# Altium schematic sheet Connector_Section.SchDoc
size A4; DocumentNumber: 7; SheetNumber: 7; SheetTotal: 7
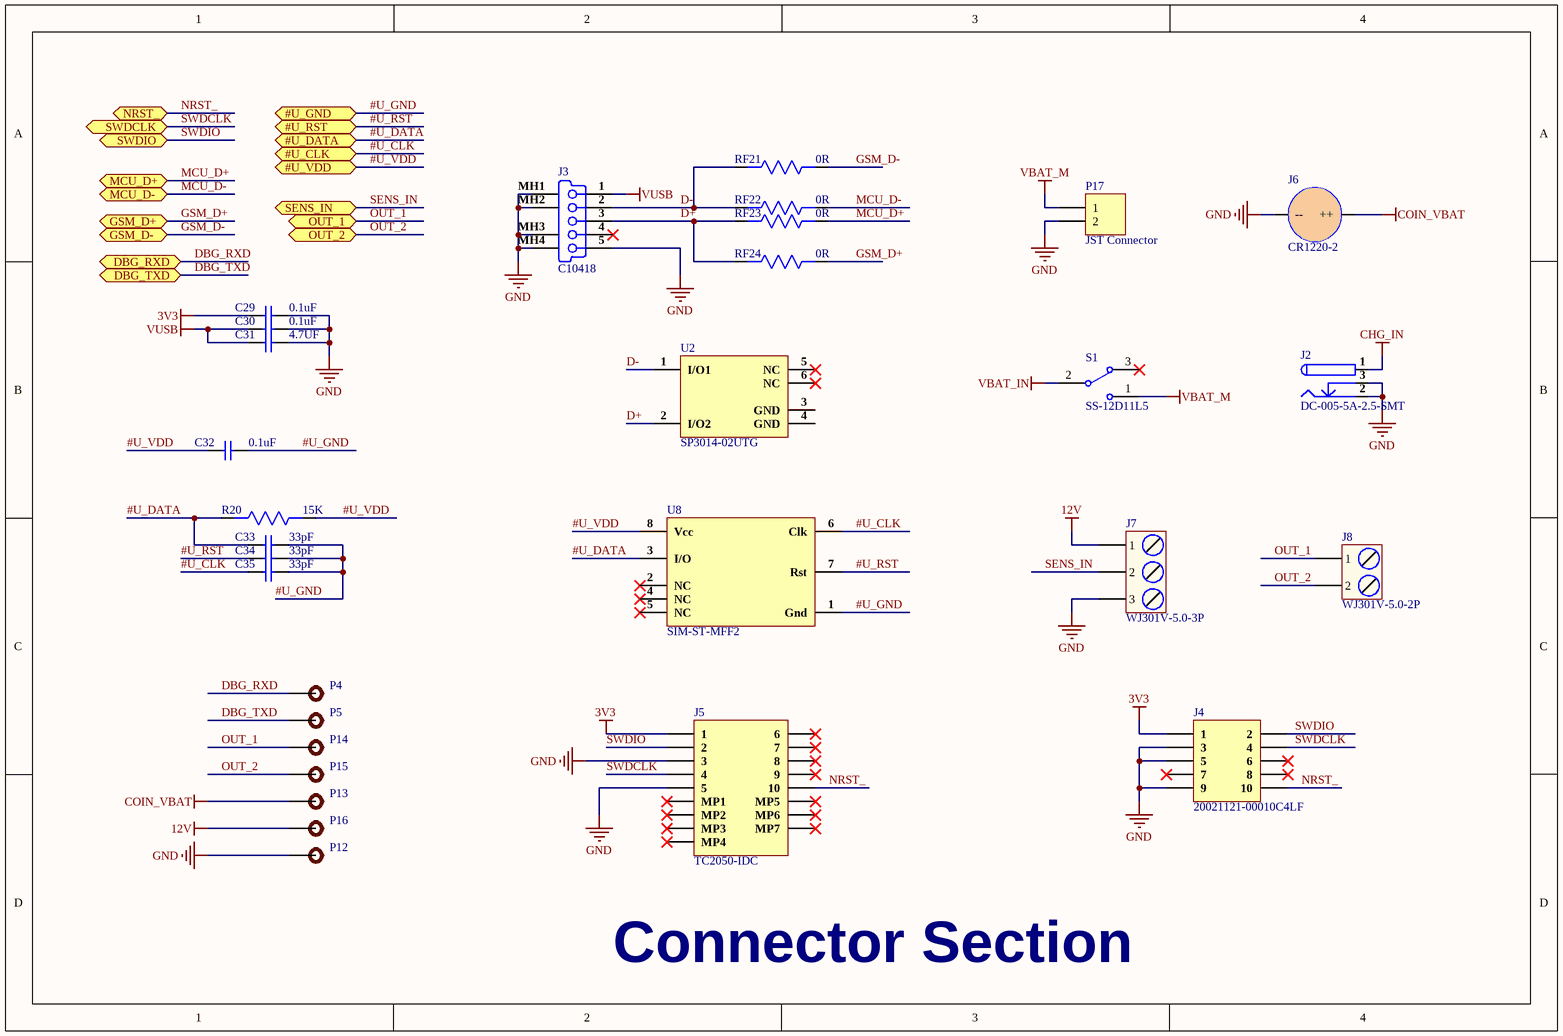
[diagram p0: Connector_Section.SchDoc]

## Parts
C29  0.1uF  [Cap0402]
C30  0.1uF  [Cap0402]
C31  4.7UF  [Cap0603]
C32  0.1uF  [Cap0402]
C33  33pF  [Cap0402]
C34  33pF  [Cap0402]
C35  33pF  [Cap0402]
J2  DC-005-5A-2.5-SMT  [DC-005-5A-2.5-SMT]
J3  C10418  [C10418]
J4  20021121-00010C4LF  [20021121-00010C4LF]
J5  TC2050-IDC  [TC2050-IDC]
J6  CR1220-2  [CR1220-2]
J7  WJ301V-5.0-3P  [WJ301V-5.0-3P]
J8  WJ301V-5.0-2P  [WJ301V-5.0-2P]
P4  Test Point  [TEST POINT]  (value not drawn)
P5  Test Point  [TEST POINT]  (value not drawn)
P12  Test Point  [TEST POINT]  (value not drawn)
P13  Test Point  [TEST POINT]  (value not drawn)
P14  Test Point  [TEST POINT]  (value not drawn)
P15  Test Point  [TEST POINT]  (value not drawn)
P16  Test Point  [TEST POINT]  (value not drawn)
P17  JST Connector  [2 PIN JST Connector]
R20  15K  [Res0402]
RF21  0R  [Res0402]
RF22  0R  [Res0402]
RF23  0R  [Res0402]
RF24  0R  [Res0402]
S1  SS-12D11L5  [SS-12D11L5]
U2  SP3014-02UTG  [SP3014-02UTG]
U8  SIM-ST-MFF2  [SIM-ST-MFF2]

## Ports
#U_CLK (bidir), #U_DATA (bidir), #U_GND (bidir), #U_RST (bidir), #U_VDD (bidir), DBG_RXD (bidir), DBG_TXD (bidir), GSM_D+ (bidir), GSM_D- (bidir), MCU_D+ (bidir), MCU_D- (bidir), NRST_ (bidir), OUT_1 (bidir), OUT_2 (bidir), SENS_IN (bidir), SWDCLK (bidir), SWDIO (bidir)

## Nets
3V3: C29.1 J4.1 J5.1
12V: J7.1 P16.1
CHG_IN: J2.1
COIN_VBAT: J6.1(++) P13.1
GND: C29.2 C30.2 C31.2 J2.2 J2.3 J3.5(GND) J3.MH1(Tab) J3.MH2(Tab) J3.MH3(Tab) J3.MH4(Tab) J4.3 J4.5 J4.9 J5.3 J5.5 J6.2(--) J7.3 P12.1 P17.2
VBAT_IN: S1.2
VBAT_M: P17.1 S1.1
VUSB: C30.1 C31.1 J3.1(V_BUS_(5V))
#U_CLK: C35.1 U8.6(Clk) ; port #U_CLK
#U_DATA: C33.1 R20.2 U8.3(I/O) ; port #U_DATA
#U_GND: C32.2 C33.2 C34.2 C35.2 U8.1(Gnd) ; port #U_GND
#U_RST: C34.1 U8.7(Rst) ; port #U_RST
#U_VDD: C32.1 R20.1 U8.8(Vcc) ; port #U_VDD
D+: J3.3(D+) RF23.2 RF24.2 U2.2(I/O2)
D-: J3.2(D-) RF21.2 RF22.2 U2.1(I/O1)
DBG_RXD: P4.1 ; port DBG_RXD
DBG_TXD: P5.1 ; port DBG_TXD
GSM_D+: RF24.1 ; port GSM_D+
GSM_D-: RF21.1 ; port GSM_D-
MCU_D+: RF23.1 ; port MCU_D+
MCU_D-: RF22.1 ; port MCU_D-
NRST_: J4.10 J5.10 ; port NRST_
OUT_1: J8.1 P14.1 ; port OUT_1
OUT_2: J8.2 P15.1 ; port OUT_2
SENS_IN: J7.2 ; port SENS_IN
SWDCLK: J4.4 J5.4 ; port SWDCLK
SWDIO: J4.2 J5.2 ; port SWDIO

Not connected (* = marked no-connect by the designer): J3 4(NC)*; J4 6* 7* 8*; J5 6* 7* 8* 9* MP1* MP2* MP3* MP4* MP5* MP6* MP7*; J6 MH1 MH2; S1 3*; U2 3(GND) 4(GND) 5(NC)* 6(NC)*; U8 2(NC)* 4(NC)* 5(NC)*

## Notes on the sheet
- Connector Section

## Library data of the parts
C29 C30 C32 = CC0402KRX7R7BB104: CAP CER 0.1UF 16V X7R 0402; Manufacturer: Yageo; Tolerance: 10%; Capacitance: 100nF; Supplier 1: Digi-Key; Manufacturer Part Number: CC0402KRX7R7BB104; Stock 1: 16982736; Pricing 1: 1=0.1, 10=0.034, 100=0.015, 500=0.0107, 1000=0.00841, 2500=0.00764, 5000=0.00703 (USD); Mount: Surface Mount; Case/Package: 0402; Number of Pins: 2; Case Code (Metric): 1005; Case Code (Imperial): 0402; Min Operating Temperature: -55°C; Max Operating Temperature: 125°C; Dielectric: X7R; Voltage Rating: 16V; Voltage Rating (DC): 16V; Packaging: Tape and Reel; Package Quantity: 1; Termination: SMD/SMT; Composition: Ceramic; Voltage: 16V; Length: 1mm; Height: 0.5mm; Width: 0.02inch; Thickness: 0.022inch; Depth: 0.5mm; Radiation Hardening: No; REACH SVHC: No SVHC; Lead Free: Lead Free; Halogen Free: Halogen Free; ComponentLink1URL: http://www.yageo.com/documents/recent/UPY-GPHC_X7R_6.3V-to-50V_8.pdf?src-supplier=Avnet+Europe; ComponentLink1Description: http://www.yageo.com/documents/recent/UPY-GPHC_X7R_6.3V-to-50V_8.pdf?src-supplier=Avnet+Europe; ComponentLink2URL: http://www.yageo.com/documents/recent/UPY-GPHC_X7R_6.3V-to-50V_18.pdf?src-supplier=Digi-Key; ComponentLink2Description: http://www.yageo.com/documents/recent/UPY-GPHC_X7R_6.3V-to-50V_18.pdf?src-supplier=Digi-Key; ComponentLink3URL: http://www.yageo.com/documents/recent/UPY-GPHC_X7R_6.3V-to-50V_8.pdf?src-supplier=Avnet; ComponentLink3Description: http://www.yageo.com/documents/recent/UPY-GPHC_X7R_6.3V-to-50V_8.pdf?src-supplier=Avnet; ComponentLink4URL: http://www.yageo.com/documents/recent/UPY-GPHC_X7R_6.3V-to-50V_18.pdf?src-supplier=Mouser; ComponentLink4Description: http://www.yageo.com/documents/recent/UPY-GPHC_X7R_6.3V-to-50V_18.pdf?src-supplier=Mouser; ComponentLink5URL: http://www.farnell.com/datasheets/2167236.pdf?src-supplier=Element14; ComponentLink5Description: http://www.farnell.com/datasheets/2167236.pdf?src-supplier=Element14; ComponentLink6URL: http://www.farnell.com/datasheets/1489800.pdf?src-supplier=Element14; ComponentLink6Description: http://www.farnell.com/datasheets/1489800.pdf?src-supplier=Element14; Supplier Part Number 1: 311-1338-1-ND
C31 = CL10A475KA8NQNC: CAP CER 4.7UF 25V X5R 0603; Manufacturer: Samsung; Tolerance: 10%; Supplier 1: Digi-Key; Manufacturer Part Number: CL10A475KA8NQNC; Stock 1: 2252340; Pricing 1: 1=0.37, 10=0.255, 100=0.1528, 500=0.11456, 1000=0.09675 (USD); Mount: Surface Mount; Case/Package: 0603; Case Code (Metric): 1608; Case Code (Imperial): 0603; Contact Plating: Tin; Min Operating Temperature: -55°C; Max Operating Temperature: 85°C; Package Quantity: 1; Packaging: Tape and Reel; Capacitance: 4.7uF; Voltage Rating: 25V; Dielectric: X5R; Termination: Wraparound; Length: 1.6mm; Width: 0.031inch; Thickness: 0.035inch; Depth: 0.8mm; Lead Free: Lead Free; ComponentLink1URL: http://www.samsungsem.com/kr/support/product-search/mlcc/CL10A475KA8NQNC.jsp?src-supplier=Digi-Key; ComponentLink1Description: http://www.samsungsem.com/kr/support/product-search/mlcc/CL10A475KA8NQNC.jsp?src-supplier=Digi-Key; Supplier Part Number 1: 1276-1900-1-ND
C33-C35 = 0402N330K250CT: 33pF ±10% 25V NP0(C0G) 0402 Multilayer Ceramic Capacitors MLCC - SMD/SMT RoHS; Manufacturer: Walsin Tech Corp; Manufacturer Part No: 0402N330K250CT; Package: 0402; Value: 33pF
J2 = DC-005-5A-2.5-SMT: DC Power Receptacle Jack 2.5A 2.5mm 6.5mm SMD Power Connectors RoHS; Manufacturer: XKB Enterprise; Value: Custom; Manufacturer Part No: DC-005-5A-2.5-SMT; Package: Custom
J3 = C10418: USB - Micro B Female USB 2 5 SMD USB Connectors RoHS; Manufacturer: Jing Extension of the Electronic Co.; Gender: Receptacle; Connector Type: USB,Receptacle; Number of Contacts: 5; Number of Ports: 1; Manufacturer Part Number: C10418; Mount: Surface Mount,Horizontal; Number of Terminals: 5; Termination: Solder; Orientation: Right Angle; ComponentLink1URL: http://www.amphenol-icc.com/media/wysiwyg/files/drawing/10118194.pdf?src-supplier=Digi-Key; ComponentLink1Description: http://www.amphenol-icc.com/media/wysiwyg/files/drawing/10118194.pdf?src-supplier=Digi-Key; ComponentLink2URL: https://cdn.amphenol-icc.com/media/wysiwyg/files/drawing/10118194.pdf?src-supplier=Mouser; ComponentLink2Description: https://cdn.amphenol-icc.com/media/wysiwyg/files/drawing/10118194.pdf?src-supplier=Mouser; ComponentLink3URL: https://cdn.amphenol-icc.com/media/wysiwyg/files/drawing/10118194.pdf?src-supplier=Verical; ComponentLink3Description: https://cdn.amphenol-icc.com/media/wysiwyg/files/drawing/10118194.pdf?src-supplier=Verical; Link: https://lcsc.com/product-detail/USB-Connectors_Jing-Extension-of-the-Electronic-Co-C10418_C10418.html
J4 = 20021121-00010C4LF: CONN HEADER SMD 10POS 1.27MM
J5 = TC2050-IDC: CBL PLUG-OF-NAILS 10-PIN W/LEGS; Manufacturer: Tag-Connect; Supplier 1: Digi-Key; Manufacturer Part Number: TC2050-IDC; Stock 1: 59; Pricing 1: 1=40.17 (USD); Package Quantity: 1; ComponentLink1URL: http://www.tag-connect.com/Materials/TC2050-IDC%20Datasheet.pdf?src-supplier=Digi-Key; ComponentLink1Description: http://www.tag-connect.com/Materials/TC2050-IDC%20Datasheet.pdf?src-supplier=Digi-Key; Supplier Part Number 1: TC2050-IDC-ND
J6 = CR1220-2: SMD Battery Holders, Clips & Contacts RoHS; Manufacturer: Q&J; Value: Cuctom; Manufacturer Part No: CR1220-2; Package: Cuctom
J7 = WJ301V-5.0-3P: P=5.0mm Screw terminal RoHS; Manufacturer: Ningbo Kangnex Elec; Value: Custom; Manufacturer Part No: WJ301V-5.0-3P; Package: Custom
J8 = WJ301V-5.0-2P: P=5.0mm Screw terminal RoHS; Manufacturer: Ningbo Kangnex Elec; Value: Custom; Manufacturer Part No: WJ301V-5.0-2P; Package: Custom
P4 P5 P12-P16 = TEST POINT: Test Point ON
P17 = 2 Pin JST Connector
R20 = RMC10-153JTH: 15K ±5% 1/10W ±200ppm/℃ 0402 Chip Resistor - Surface Mount RoHS; Manufacturer: KAMAYA; Manufacturer Part No: RMC10-153JTH; Package: 0402; Value: 15K
RF21-RF24 = RC0402JR-070RL: RES SMD 0 OHM JUMPER 1/16W 0402; Manufacturer: Yageo; Manufacturer Part Number: RC0402FR-070RL; Resistance: 0mR; Tolerance: 1%; Power Rating: 62.5mW; Voltage Rating: 50V; Temperature Coefficient: 200ppm/°C; Supplier 1: Digi-Key; Stock 1: 3681314; Pricing 1: 1=0.1, 10=0.013, 25=0.0092, 50=0.0072, 100=0.0053, 250=0.004, 500=0.0032, 1000=0.00236, 5000=0.00169 (USD); Mount: Surface Mount; Case/Package: 0402; Contact Plating: Tin,Matte; Case Code (Imperial): 0402; Case Code (Metric): 1005; Min Operating Temperature: -55°C; Max Operating Temperature: 155°C; Composition: Thick Film; Packaging: Tape and Reel; Termination: SMD/SMT; Length: 1mm; Height: 0.35mm; Width: 0.5mm; Radiation Hardening: No; Lead Free: Lead Free; ComponentLink1URL: http://www.yageo.com/documents/recent/PYu-RC0402_51_RoHS_L_6.pdf?src-supplier=Avnet; ComponentLink1Description: http://www.yageo.com/documents/recent/PYu-RC0402_51_RoHS_L_6.pdf?src-supplier=Avnet; ComponentLink2URL: http://www.yageo.com/documents/recent/PYu-RC0402_51_RoHS_L_6_r.pdf?src-supplier=Future+Electronics; ComponentLink2Description: http://www.yageo.com/documents/recent/PYu-RC0402_51_RoHS_L_6_r.pdf?src-supplier=Future+Electronics; ComponentLink3URL: http://www.yageo.com/documents/recent/PYu-RC0402_51_RoHS_L_6.pdf?src-supplier=Avnet+Europe; ComponentLink3Description: http://www.yageo.com/documents/recent/PYu-RC0402_51_RoHS_L_6.pdf?src-supplier=Avnet+Europe; Supplier Part Number 1: 311-0.0LRCT-ND
S1 = SS-12D11L5: SPDT 5A 120V On-On DIP Toggle Switches RoHS; Manufacturer: XKB Enterprise; Value: Custom; Manufacturer Part No: SS-12D11L5; Package: Custom
U2 = SP3014-02UTG: TVS DIODE 5V 6.8V 6UDFN; Manufacturer: Littelfuse; Capacitance: 1E-12F; Number of Bidirectional Channels: 2; Power Line Protection: Yes; Polarity: Unidirectional; Max Surge Current: 8A; Supplier 1: Digi-Key; Manufacturer Part Number: SP3014-02UTG; Stock 1: 3888; Pricing 1: 1=0.56, 10=0.495, 25=0.4652, 100=0.3375, 250=0.32552, 500=0.282, 1000=0.24 (USD); Mount: Surface Mount; Number of Pins: 6; Min Operating Temperature: -40°C; Max Operating Temperature: 125°C; Packaging: Tape and Reel; Reverse Standoff Voltage: 5V; Clamping Voltage: 6.8V; Termination: SMD/SMT; Number of Channels: 2; Working Voltage: 5V; Package Quantity: 3000; Peak Pulse Current: 8A; Length: 1.65mm; Height: 0.55mm; Width: 1.05mm; ComponentLink1URL: http://www.mouser.com/ds/2/240/Littelfuse_TVS_Diode_Array_SP3014_Datasheet.pdf-364113.pdf?src-supplier=Mouser; ComponentLink1Description: http://www.mouser.com/ds/2/240/Littelfuse_TVS_Diode_Array_SP3014_Datasheet.pdf-364113.pdf?src-supplier=Mouser; ComponentLink2URL: https://www.littelfuse.com/~/media/electronics/datasheets/tvs_diode_arrays/littelfuse_tvs_diode_array_sp3014_datasheet.pdf.pdf?src-supplier=Digi-Key; ComponentLink2Description: https://www.littelfuse.com/~/media/electronics/datasheets/tvs_diode_arrays/littelfuse_tvs_diode_array_sp3014_datasheet.pdf.pdf?src-supplier=Digi-Key; ComponentLink3URL: http://www.littelfuse.com/~/media/electronics/datasheets/tvs_diode_arrays/littelfuse_tvs_diode_array_sp3014_datasheet.pdf.pdf?src-supplier=Digi-Key; ComponentLink3Description: http://www.littelfuse.com/~/media/electronics/datasheets/tvs_diode_arrays/littelfuse_tvs_diode_array_sp3014_datasheet.pdf.pdf?src-supplier=Digi-Key; ComponentLink4URL: http://www.farnell.com/datasheets/2291833.pdf?src-supplier=Element14; ComponentLink4Description: http://www.farnell.com/datasheets/2291833.pdf?src-supplier=Element14; ComponentLink5URL: http://www.farnell.com/datasheets/2291833.pdf?src-supplier=Farnell; ComponentLink5Description: http://www.farnell.com/datasheets/2291833.pdf?src-supplier=Farnell; ComponentLink6URL: http://www.farnell.com/datasheets/2291833.pdf?src-supplier=Newark; ComponentLink6Description: http://www.farnell.com/datasheets/2291833.pdf?src-supplier=Newark; Supplier Part Number 1: F6501DKR-ND
U8 = SIM-ST-MFF2: GLOBAL IOT EMBEDDED SIM CHIP; Manufacturer: Hologram; Supplier 1: Digi-Key; Manufacturer Part Number: SIM-ST-MFF2; Stock 1: 0; Pricing 1: 1=6.3, 100=5.985 (USD); ComponentLink1URL: https://media.digikey.com/pdf/Data%20Sheets/Hologram%20PDFs/SIM_DS_170107_v2.pdf?src-supplier=Digi-Key; ComponentLink1Description: https://media.digikey.com/pdf/Data%20Sheets/Hologram%20PDFs/SIM_DS_170107_v2.pdf?src-supplier=Digi-Key; Supplier Part Number 1: 1887-1002-1-ND